# Altium project Interface_Board.PrjPcb
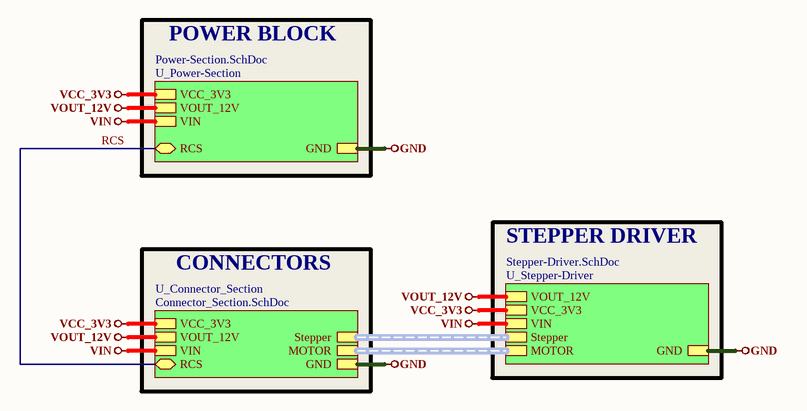
[diagram p0: Top-Sheet.SchDoc]
6 sheets, 66 parts. Net scope: strictly hierarchical (ports join the sheet entries above them; power ports are local).
Board file: InterfaceBoard_PCB.PcbDoc
Sheets:
  Top-Sheet.SchDoc
    U_Power-Section = Power-Section.SchDoc
      U_Pump-Power = Pump-Power.SchDoc
      U_MCU-Power = MCU-Power.SchDoc
    U_Stepper-Driver = Stepper-Driver.SchDoc
    U_Connector_Section = Connector_Section.SchDoc

## Sheet Top-Sheet.SchDoc
size A4; SheetNumber: 1

### Sub-sheets
U_Connector_Section = Connector_Section.SchDoc: GND, VCC_3V3, VOUT_12V, RCS (bidir), Stepper (harness Stepper), VIN, MOTOR (harness MOTOR)
U_Power-Section = Power-Section.SchDoc: VCC_3V3, GND, VOUT_12V, VIN, RCS (bidir)
U_Stepper-Driver = Stepper-Driver.SchDoc: Stepper (harness Stepper), MOTOR (harness MOTOR), VOUT_12V, GND, VCC_3V3, VIN

### Nets
GND: sheet U_Power-Section/GND, sheet U_Stepper-Driver/GND, sheet U_Connector_Section/GND
VCC_3V3: sheet U_Power-Section/VCC_3V3, sheet U_Stepper-Driver/VCC_3V3, sheet U_Connector_Section/VCC_3V3
VIN: sheet U_Power-Section/VIN, sheet U_Stepper-Driver/VIN, sheet U_Connector_Section/VIN
VOUT_12V: sheet U_Power-Section/VOUT_12V, sheet U_Stepper-Driver/VOUT_12V, sheet U_Connector_Section/VOUT_12V
RCS: sheet U_Power-Section/RCS, sheet U_Connector_Section/RCS

### Buses and harness runs
harness sheet U_Connector_Section/MOTOR = sheet U_Stepper-Driver/MOTOR
harness sheet U_Connector_Section/Stepper = sheet U_Stepper-Driver/Stepper

### Notes on the sheet
- POWER BLOCK
- CONNECTORS
- STEPPER DRIVER

## Sheet Power-Section.SchDoc
size A4; SheetNumber: 2
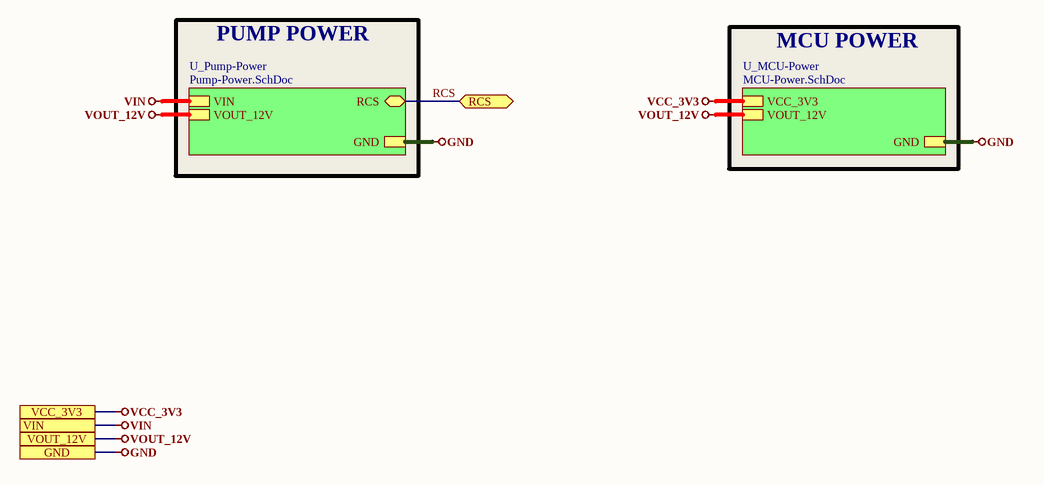
[diagram p1: Power-Section.SchDoc]

### Sub-sheets
U_MCU-Power = MCU-Power.SchDoc: VCC_3V3, GND, VOUT_12V
U_Pump-Power = Pump-Power.SchDoc: RCS (bidir), VOUT_12V, VIN, GND

### Ports
GND, RCS (bidir), VCC_3V3, VIN, VOUT_12V

### Nets
GND: port GND, sheet U_Pump-Power/GND, sheet U_MCU-Power/GND
VCC_3V3: port VCC_3V3, sheet U_MCU-Power/VCC_3V3
VIN: port VIN, sheet U_Pump-Power/VIN
VOUT_12V: port VOUT_12V, sheet U_Pump-Power/VOUT_12V, sheet U_MCU-Power/VOUT_12V
RCS: port RCS, sheet U_Pump-Power/RCS

### Notes on the sheet
- PUMP POWER
- MCU POWER

## Sheet Pump-Power.SchDoc
size A4; SheetNumber: 4
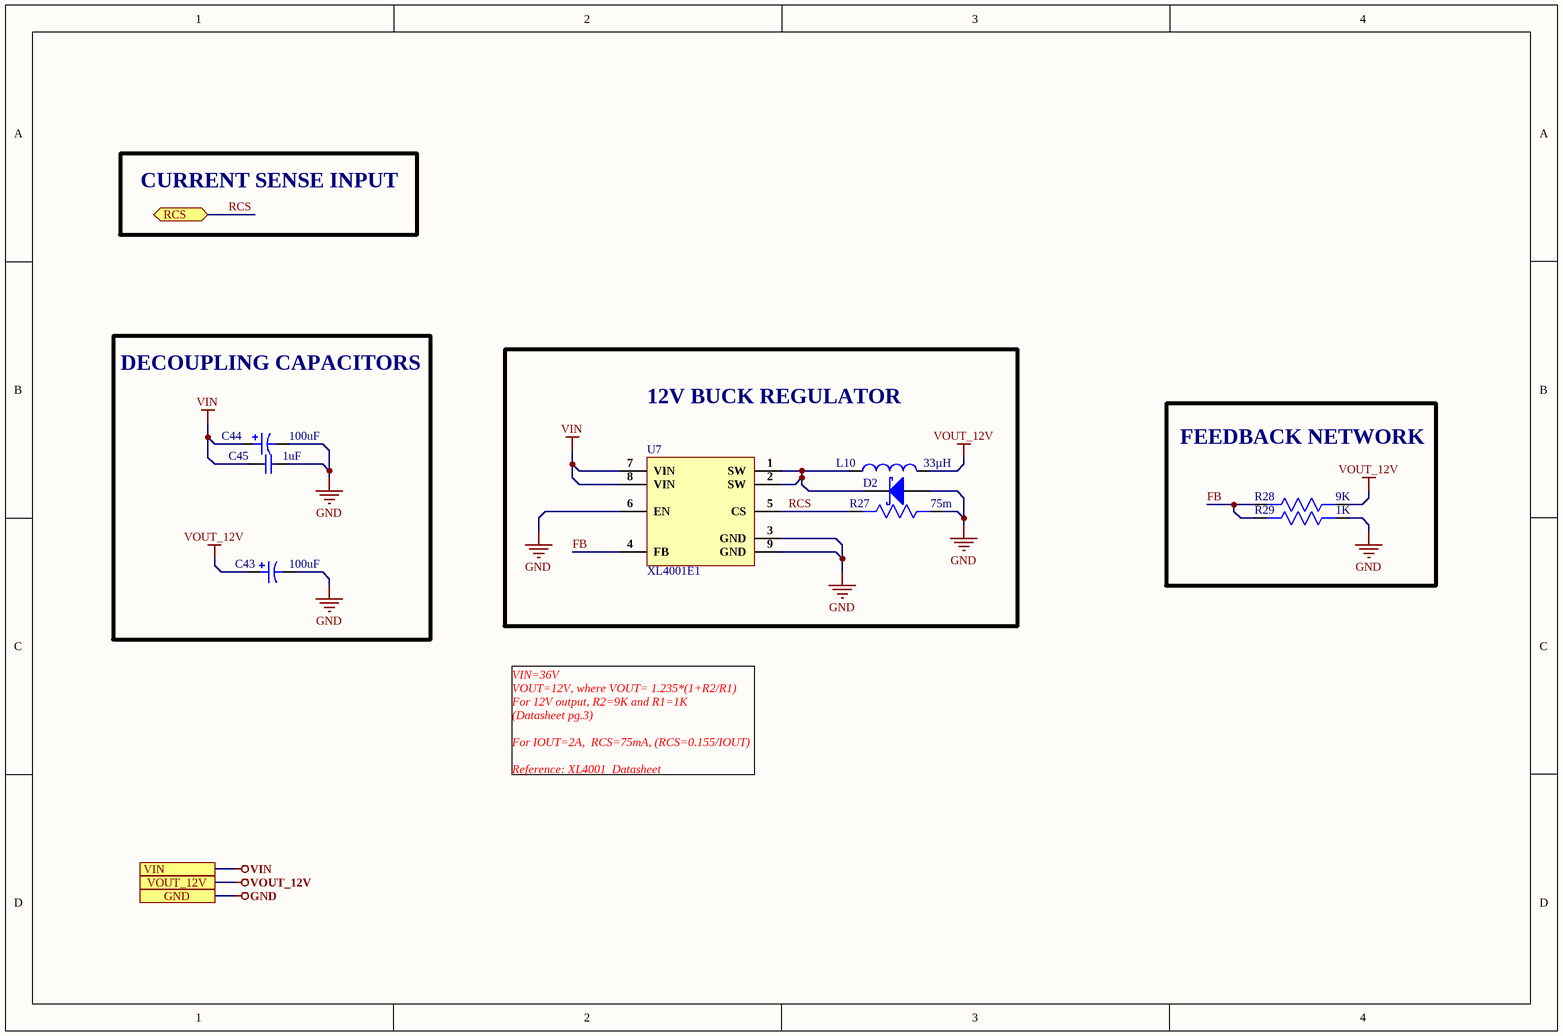
[diagram p2: Pump-Power.SchDoc]

### Parts
C43  100uF  [VKMB1001E101MV]
C44  100uF  [VKMD1001J101MV]
C45  1uF  [Cap0805]
D2  PMEG3030EP,115  [PMEG3030EP,115]  (value not drawn)
L10  33µH  [ETQ-P4M330YFN]
R27  75m  [RES 2512]
R28  9K  [RES 0805]
R29  1K  [Res0603]
U7  XL4001E1  [XL4001E1]

### Blocks framed on the sheet
DECOUPLING CAPACITORS: C43-C45
12V BUCK REGULATOR: D2 L10 R27 U7
FEEDBACK NETWORK: R28 R29

### Ports
GND, RCS (bidir), VIN, VOUT_12V

### Nets
GND: C43.2 C44.2 C45.2 D2.1(A) R27.1 R29.1 U7.3(GND) U7.6(EN) U7.9(GND) ; port GND
VIN: C44.1 C45.1 U7.7(VIN) U7.8(VIN) ; port VIN
VOUT_12V: C43.1 L10.2 R28.1 ; port VOUT_12V
FB: R28.2 R29.2 U7.4(FB)
RCS: R27.2 U7.5(CS) ; port RCS
NetD2_2: D2.2(K) L10.1 U7.1(SW) U7.2(SW)

### Notes on the sheet
- CURRENT SENSE INPUT
- VIN=36V
  VOUT=12V, where VOUT= 1.235*(1+R2/R1)
  For 12V output, R2=9K and R1=1K
  (Datasheet pg.3)
  For IOUT=2A,  RCS=75mA, (RCS=0.155/IOUT)
  Reference: XL4001  Datasheet

### Library data of the parts
C43 = VKMB1001E101MV: 25V 5mm 10mm 100uF 100kHz SMD,5x10mm Aluminum Electrolytic Cap- SMD ROHS; Manufacturer: Ymin; Manufacturer Part No: VKMB1001E101MV; Value: 100uF; Voltage: 25V; ComponentLink1Description: LCSC; ComponentLink1URL: https://lcsc.com/product-detail/Aluminum-Electrolytic-Capacitors-SMD_Ymin-VKMB1001E101MV_C487322.html
C44 = VKMD1001J101MV: 63V 10mm 8mm 100uF ±20% ,8x10mm Aluminum Electrolytic Cap; Manufacturer: Ymin; Manufacturer Part No: VKMD1001J101MV; Value: 100uF; Voltage: 63V; ComponentLink1Description: LCSC; ComponentLink1URL: https://lcsc.com/product-detail/Aluminum-Electrolytic-Capacitors-SMD_Ymin-VKMD1001J101MV_C487384.html
C45 = GCM21BC72A105KE36L: CAP CER 1UF 100V X7S 0805; Manufacturer: Murata; Tolerance: 10%; Supplier 1: Digi-Key; Manufacturer Part Number: GCM21BC72A105KE36L; RoHS: Yes; Category: Ceramic Capacitors; Stock 1: 179138; Pricing 1: 1=0.48000, 10=0.34100, 50=0.25800, 100=0.22480, 500=0.16650, 1000=0.14152 (USD); Mount: Surface Mount; Case/Package: 0805; Case Code (Imperial): 0805; Case Code (Metric): 2012; Min Operating Temperature: -55°C; Max Operating Temperature: 125°C; Packaging: Cut Tape; Capacitance: 1uF; Voltage Rating: 100V; Ratings: AEC-Q200; RoHS Compliant: Yes; ComponentLink1URL: http://search.murata.co.jp/Ceramy/image/img/A01X/partnumbering_e_02.pdf?src-supplier=Digi-Key; ComponentLink1Description: http://search.murata.co.jp/Ceramy/image/img/A01X/partnumbering_e_02.pdf?src-supplier=Digi-Key; Supplier Part Number 1: 490-14436-1-ND
D2 = PMEG3030EP,115: Diode Schottky 30V 3A 2-Pin SOD-128 T/R; Manufacturer: NXP Semiconductors; Manufacturer Part Number: PMEG3030EP-115; Max Reverse Current: 1.5mA; Peak Non-Repetitive Surge Current: 50A; Element Configuration: Single; Forward Voltage: 360mV; Power Dissipation: 625mW; Supplier 1: Newark; RoHS: Yes; Category: Rectifier Diodes; Mount: Surface Mount; Number of Pins: 2; Min Operating Temperature: -55°C; Max Operating Temperature: 150°C; Forward Current: 3A; Max Repetitive Reverse Voltage (Vrrm): 30V; Package Quantity: 1; Max Surge Current: 50A; Packaging: Tape and Reel; Average Rectified Current: 3A; Reverse Voltage: 30V; Max Reverse Voltage (DC): 30V; Series: -; Radiation Hardening: No; Lead Free: Lead Free; ComponentLink1URL: https://datasheet.ciiva.com/4453/pmeg3030ep-103074-4453360.pdf?src-supplier=Mouser; ComponentLink1Description: https://datasheet.ciiva.com/4453/pmeg3030ep-103074-4453360.pdf?src-supplier=Mouser; ComponentLink2URL: https://datasheet.ciiva.com/8299/pmeg3030ep-8299156.pdf?src-supplier=Avnet; ComponentLink2Description: https://datasheet.ciiva.com/8299/pmeg3030ep-8299156.pdf?src-supplier=Avnet; ComponentLink3URL: https://datasheet.ciiva.com/917/pmeg3030ep-917049.pdf?src-supplier=Digi-Key; ComponentLink3Description: https://datasheet.ciiva.com/917/pmeg3030ep-917049.pdf?src-supplier=Digi-Key; ComponentLink4URL: https://datasheet.ciiva.com/917/pmeg3030ep-917048.pdf?src-supplier=Digi-Key; ComponentLink4Description: https://datasheet.ciiva.com/917/pmeg3030ep-917048.pdf?src-supplier=Digi-Key; ComponentLink5URL: https://datasheet.ciiva.com/917/pmeg3030ep-917050.pdf?src-supplier=Digi-Key; ComponentLink5Description: https://datasheet.ciiva.com/917/pmeg3030ep-917050.pdf?src-supplier=Digi-Key; ComponentLink6URL: https://datasheet.ciiva.com/8299/pmeg3030ep-8299301.pdf?src-supplier=Avnet; ComponentLink6Description: https://datasheet.ciiva.com/8299/pmeg3030ep-8299301.pdf?src-supplier=Avnet; Supplier Part Number 1: 85W3397
L10 = ETQ-P4M330YFN: FIXED IND 33UH 2.5A 189.2MOHM SM; Manufacturer: Panasonic; Core Material: Metal,Composite; Tolerance: 20%; Saturation Current: 4.1A; Shielding: Shielded; DC Resistance (DCR): 189.2mR; Test Frequency: 100kHz; Supplier 1: Digi-Key; Manufacturer Part Number: ETQ-P4M330YFN; RoHS: No; Category: Fixed Inductors; Stock 1: 482; Pricing 1: 1=1.56000, 10=1.44400, 25=1.33320, 50=1.11100, 100=1.04430, 250=0.93324 (USD); Mount: Surface Mount; Case/Package: SMD/SMT; Min Operating Temperature: -40°C; Max Operating Temperature: 150°C; Packaging: Tape and Reel; Inductance: 33uH; Current Rating: 2.5A; Ratings: AEC-Q200; ComponentLink1URL: https://industrial.panasonic.com/cdbs/www-data/pdf/AGL0000/AGL0000C59.pdf?src-supplier=Digi-Key; ComponentLink1Description: https://industrial.panasonic.com/cdbs/www-data/pdf/AGL0000/AGL0000C59.pdf?src-supplier=Digi-Key; Supplier Part Number 1: P122549CT-ND
R27 = CSRN2512FK75L0: RES 0.075 OHM 1% 2W 2512; Manufacturer: Stackpole Electronics; Resistance: 75mR; Temperature Coefficient: 200ppm/°C; Supplier 1: Digi-Key; Manufacturer Part Number: CSRN2512FK75L0; RoHS: Yes; Category: Chip SMD Resistors; Stock 1: 153268; Pricing 1: 1=0.58000, 10=0.42500, 25=0.34480, 50=0.30000, 100=0.24750, 250=0.21500, 500=0.17500 (USD); Mount: Surface Mount; Case/Package: 2512; Case Code (Metric): 6432; Case Code (Imperial): 2512; Min Operating Temperature: -55°C; Max Operating Temperature: 155°C; Tolerance: 1%; Packaging: Tape and Reel; Resistor Type: Thick Film; Number of Terminations: 2; Max Power Dissipation: 2W; Series: CSRN; Length: 0.25inch; Width: 0.124inch; Height: 0.028inch; Lead Free: Lead Free; RoHS Compliant: Yes; ComponentLink1URL: https://www.seielect.com/catalog/SEI-Packaging.pdf?src-supplier=Digi-Key; ComponentLink1Description: https://www.seielect.com/catalog/SEI-Packaging.pdf?src-supplier=Digi-Key; ComponentLink2URL: https://www.seielect.com/Catalog/SEI-CSR_CSRN.pdf?src-supplier=Digi-Key; ComponentLink2Description: https://www.seielect.com/Catalog/SEI-CSR_CSRN.pdf?src-supplier=Digi-Key; Supplier Part Number 1: CSRN2512FK75L0CT-ND
R28 = 0805W8F9001T5E: RES SMD 9kΩ ±100ppm/℃ 0.125W 0805; Manufacturer: UNI-ROYAL; Package: 0805; Resistance: 9K; Power(Watts): 0.125W
R29 = RC0603FR-071KL: RES SMD 1K OHM 1% 1/10W 0603; Manufacturer: Yageo; Resistance: 1kR; Temperature Coefficient: 100ppm/°C; Power Rating: 100mW; Voltage Rating: 50V; ComponentLink1URL: https://www.verical.com/server-webapp/html/getDatasheet?partID=409289&src-supplier=Verical; ComponentLink1Description: https://www.verical.com/server-webapp/html/getDatasheet?partID=409289&src-supplier=Verical; Supplier 1: Digi-Key; Manufacturer Part Number: RC0603FR-071KL; Stock 1: 21472395; Pricing 1: 1=0.1, 10=0.023, 100=0.0094, 1000=0.0042, 2500=0.0037 (USD); Case/Package: 0603; Contact Plating: Tin,Matte; Case Code (Imperial): 0603; Case Code (Metric): 1608; Min Operating Temperature: -55°C; Max Operating Temperature: 155°C; Tolerance: 1%; Composition: Thick Film; Packaging: Tape and Reel; Termination: SMD/SMT; Military Standard: Not; Length: 1.6mm; Height: 0.45mm; Depth: 0.8mm; Radiation Hardening: No; REACH SVHC: No SVHC; Lead Free: Lead Free; ComponentLink2URL: http://documents.rs-components.com/techlib://itc_doclist_GB.htm?stockno=5048928&src-supplier=RSComponents; ComponentLink2Description: http://documents.rs-components.com/techlib://itc_doclist_GB.htm?stockno=5048928&src-supplier=RSComponents; ComponentLink3URL: http://www.yageo.com/documents/recent/PYu-RC0603_51_RoHS_L_4.pdf?src-supplier=Avnet+Europe; ComponentLink3Description: http://www.yageo.com/documents/recent/PYu-RC0603_51_RoHS_L_4.pdf?src-supplier=Avnet+Europe; ComponentLink4URL: http://www.farnell.com/datasheets/2167052.pdf?src-supplier=Element14; ComponentLink4Description: http://www.farnell.com/datasheets/2167052.pdf?src-supplier=Element14; ComponentLink5URL: http://www.farnell.com/datasheets/1868787.pdf?src-supplier=Element14; ComponentLink5Description: http://www.farnell.com/datasheets/1868787.pdf?src-supplier=Element14; ComponentLink6URL: http://www.yageo.com/documents/recent/PYu-RC_Group_51_RoHS_L_2.pdf?src-supplier=Avnet; ComponentLink6Description: http://www.yageo.com/documents/recent/PYu-RC_Group_51_RoHS_L_2.pdf?src-supplier=Avnet; ComponentLink7URL: https://www.verical.com/server-webapp/html/getDatasheet?partID=404327&src-supplier=Verical; ComponentLink7Description: https://www.verical.com/server-webapp/html/getDatasheet?partID=404327&src-supplier=Verical; ComponentLink8URL: http://www.farnell.com/datasheets/443971.pdf?src-supplier=Element14; ComponentLink8Description: http://www.farnell.com/datasheets/443971.pdf?src-supplier=Element14; Supplier Part Number 1: 311-1.00KHRDKR-ND
U7 = XL4001E1: 2A 40V SOIC-8_EP_150mil DC-DC Converters ROHS; Manufacturer: XLSEMI; Value: Custom; Manufacturer Part No: XL4001E1; Package: SOIC-8; ComponentLink1Description: LCSC; ComponentLink1URL: https://www.lcsc.com/product-detail/DC-DC-Converters_XLSEMI-XL4001E1_C73347.html

## Sheet MCU-Power.SchDoc
size A4; SheetNumber: 3
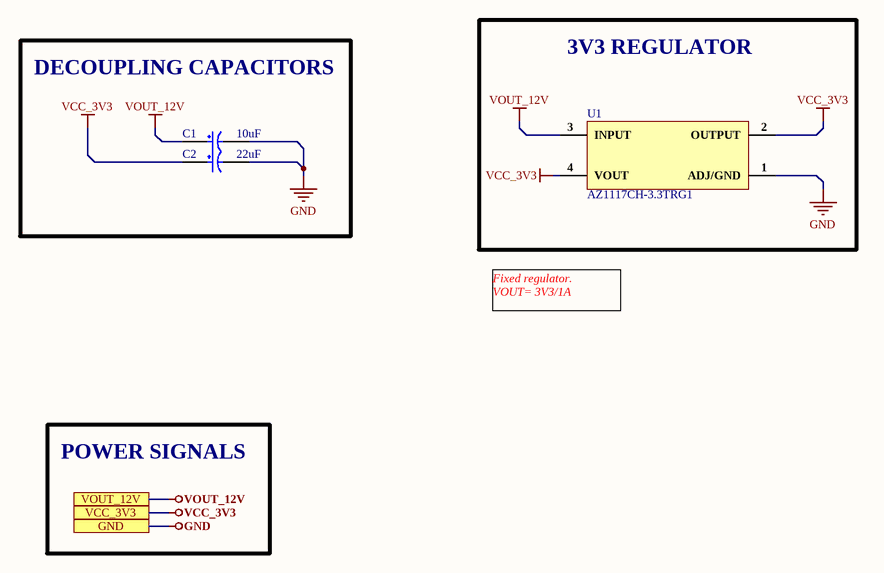
[diagram p3: MCU-Power.SchDoc]

### Parts
C1  10uF  [RVT1E100M0405.]
C2  22uF  [Cap Case-A]
U1  AZ1117CH-3.3TRG1  [AZ1117CH-3.3TRG1]

### Blocks framed on the sheet
DECOUPLING CAPACITORS: C1 C2
3V3 REGULATOR: U1

### Ports
GND, VCC_3V3, VOUT_12V

### Nets
GND: C1.2 C2.1 U1.1(ADJ/GND) ; port GND
VCC_3V3: C2.2 U1.2(OUTPUT) U1.4(VOUT) ; port VCC_3V3
VOUT_12V: C1.1 U1.3(INPUT) ; port VOUT_12V

### Notes on the sheet
- Fixed regulator.
  VOUT= 3V3/1A
- POWER SIGNALS

### Library data of the parts
C1 = RVT1E100M0405: CAP ALUM 10uF 25V SMD; Manufacturer: ROQANG; φD: 4mm; L: 5.4mm; Tolerance: ±20%; Operating Temperature: -45℃~+105℃; Rated Voltage: 25V; Capacitance: 10uF
C2 = CA45A-A-10V-22uF-K: 10V 22uF -55℃~+125℃ 6Ω 100kHz ±10% CASE-A_3216 Tantalum Capacitors ROHS; Manufacturer: CEC(Shenzhen Zhenhua XinYun Elec); Manufacturer Part No: CA45A-A-10V-22uF-K; Package: CASE-A_3216; Value: 22uF; ComponentLink1Description: LCSC; ComponentLink1URL: https://lcsc.com/product-detail/Tantalum-Capacitors_CEC-Shenzhen-Zhenhua-XinYun-Elec-CA45A-A-10V-22uF-K_C141745.html
U1 = AZ1117CH-3.3TRG1: 15V 1.3V @ 800mA Fixed 3.3V SOT-223 Linear Voltage Regulators (LDO) ROHS; Manufacturer: Diodes Incorporated; Value: Custom; Manufacturer Part No: AZ1117CH-3.3TRG1; Package: SOT-223

## Sheet Stepper-Driver.SchDoc
size A4; SheetNumber: 5
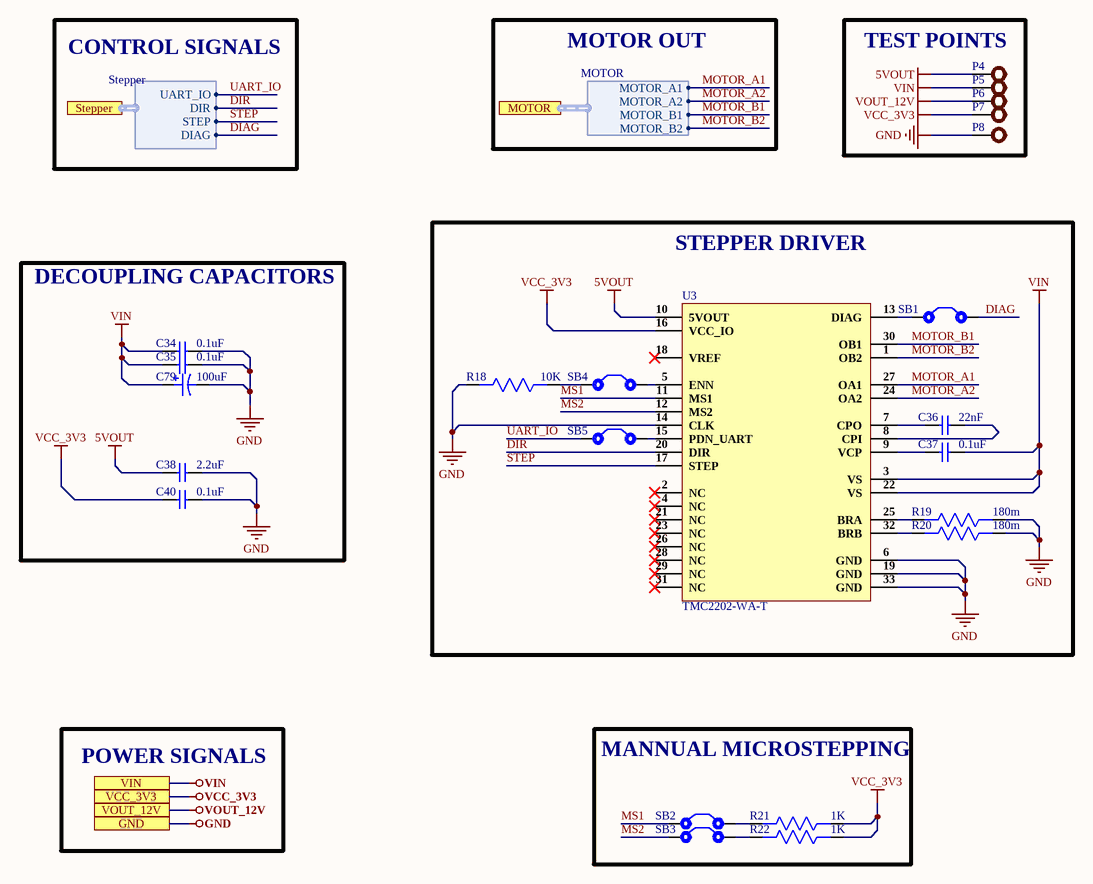
[diagram p4: Stepper-Driver.SchDoc]

### Parts
C34  0.1uF  [Cap0603]
C35  0.1uF  [Cap0603]
C36  22nF  [Cap0603]
C37  0.1uF  [Cap0603]
C38  2.2uF  [Cap0603]
C40  0.1uF  [Cap0603]
C79  100uF  [VKMD1001J101MV]
P4  Test Point  [TEST POINT]  (value not drawn)
P5  Test Point  [TEST POINT]  (value not drawn)
P6  Test Point  [TEST POINT]  (value not drawn)
P7  Test Point  [TEST POINT]  (value not drawn)
P8  Test Point  [TEST POINT]  (value not drawn)
R18  10K  [Res0603]
R19  180m  [RES 2512]
R20  180m  [RES 2512]
R21  1K  [Res0603]
R22  1K  [Res0603]
SB1  Solder Bridge  [Solder Bridge]  (value not drawn)
SB2  Solder Bridge  [Solder Bridge]  (value not drawn)
SB3  Solder Bridge  [Solder Bridge]  (value not drawn)
SB4  Solder Bridge  [Solder Bridge]  (value not drawn)
SB5  Solder Bridge  [Solder Bridge]  (value not drawn)
U3  TMC2202-WA-T  [32-QFN (5x5)]

### Blocks framed on the sheet
TEST POINTS: P4-P8
STEPPER DRIVER: C36 C37 R18-R20 SB1 SB4 SB5 U3
DECOUPLING CAPACITORS: C34 C35 C38 C40 C79
MANNUAL MICROSTEPPING: R21 R22 SB2 SB3

### Ports
GND, MOTOR (harness MOTOR), Stepper (harness Stepper), VCC_3V3, VIN, VOUT_12V

### Harnesses
Stepper: UART_IO, DIR, STEP, DIAG
MOTOR: MOTOR_A1, MOTOR_A2, MOTOR_B1, MOTOR_B2

### Nets
5VOUT: C38.1 P4.1 U3.10(5VOUT)
GND: C34.2 C35.2 C38.2 C40.2 C79.2 P8.1 R18.2 R19.1 R20.1 U3.6(GND) U3.14(CLK) U3.19(GND) U3.33(GND) ; port GND
VCC_3V3: C40.1 P7.1 R21.1 R22.1 U3.16(VCC_IO) ; port VCC_3V3
VIN: C34.1 C35.1 C37.2 C79.1 P5.1 U3.3(VS) U3.22(VS) ; port VIN
VOUT_12V: P6.1 ; port VOUT_12V
DIAG: SB1.2 ; port Stepper.DIAG
DIR: U3.20(DIR) ; port Stepper.DIR
MOTOR_A1: U3.27(OA1) ; port MOTOR.MOTOR_A1
MOTOR_A2: U3.24(OA2) ; port MOTOR.MOTOR_A2
MOTOR_B1: U3.30(OB1) ; port MOTOR.MOTOR_B1
MOTOR_B2: U3.1(OB2) ; port MOTOR.MOTOR_B2
MS1: SB2.1 U3.11(MS1)
MS2: SB3.1 U3.12(MS2)
STEP: U3.17(STEP) ; port Stepper.STEP
UART_IO: SB5.1 ; port Stepper.UART_IO
NetC36_1: C36.1 U3.7(CPO)
NetC36_2: C36.2 U3.8(CPI)
NetC37_1: C37.1 U3.9(VCP)
NetR18_1: R18.1 SB4.1
NetR19_2: R19.2 U3.25(BRA)
NetR20_2: R20.2 U3.32(BRB)
NetR21_2: R21.2 SB2.2
NetR22_2: R22.2 SB3.2
NetSB1_1: SB1.1 U3.13(DIAG)
NetSB4_2: SB4.2 U3.5(ENN)
NetSB5_2: SB5.2 U3.15(PDN_UART)

Not connected (* = marked no-connect by the designer): U3 2(NC)* 4(NC)* 18(VREF)* 21(NC)* 23(NC)* 26(NC)* 28(NC)* 29(NC)* 31(NC)*

### Notes on the sheet
- MOTOR OUT
- CONTROL SIGNALS
- POWER SIGNALS

### Library data of the parts
C34 C35 C37 C40 = CC0603KRX7R0BB104: CAP CER 0.1UF 100V X7R 0603; Manufacturer: Yageo; Capacitance: 100nF; Tolerance: 10%; Supplier 1: Digi-Key; Manufacturer Part Number: CC0603KRX7R0BB104; RoHS: Yes; Category: Ceramic Capacitors; Stock 1: 60476; Pricing 1: 1=0.19000, 10=0.13500, 50=0.07680, 100=0.06370, 500=0.04466, 1000=0.03696 (USD); Mount: Surface Mount; Case/Package: 0603; Case Code (Metric): 1608; Case Code (Imperial): 0603; Weight: 7.1E-05oz; Min Operating Temperature: -55°C; Max Operating Temperature: 125°C; Package Quantity: 4000; Voltage Rating: 100V; Packaging: Tape and Reel; Dielectric: X7R; Termination: SMD/SMT; Resistor Type: Ceramic; Voltage Rating (DC): 100V; Series: CC; Length: 0.063inch; Width: 0.031inch; Thickness: 0.035inch; Depth: 0.8mm; Lead Free: Lead Free; RoHS Compliant: Yes; ComponentLink1URL: https://datasheet.ciiva.com/6277/mlccorderingcode-6277030.pdf?src-supplier=Digi-Key; ComponentLink1Description: https://datasheet.ciiva.com/6277/mlccorderingcode-6277030.pdf?src-supplier=Digi-Key; ComponentLink2URL: https://datasheet.ciiva.com/6277/mlccorderingcode-6277081.pdf?src-supplier=Digi-Key; ComponentLink2Description: https://datasheet.ciiva.com/6277/mlccorderingcode-6277081.pdf?src-supplier=Digi-Key; ComponentLink3URL: https://datasheet.ciiva.com/6277/mlccorderingcode-6277082.pdf?src-supplier=Digi-Key; ComponentLink3Description: https://datasheet.ciiva.com/6277/mlccorderingcode-6277082.pdf?src-supplier=Digi-Key; Supplier Part Number 1: 311-1523-1-ND
C36 = CGA3E2X7R2A223K080AA: CAP CER 0.022UF 100V X7R 0603; Manufacturer: TDK; Tolerance: 10%; Supplier 1: Digi-Key; Manufacturer Part Number: CGA3E2X7R2A223K080AA; RoHS: Yes; Category: Ceramic Capacitors; Stock 1: 56079; Pricing 1: 1=0.11000, 10=0.07600, 50=0.04340, 100=0.03590, 500=0.02516, 1000=0.02083 (USD); Mount: Surface Mount; Case/Package: 0603; Case Code (Metric): 1608; Case Code (Imperial): 0603; Weight: 7.1E-05oz; Min Operating Temperature: -55°C; Max Operating Temperature: 125°C; Capacitance: 22nF; Voltage Rating: 100V; Packaging: Tape and Reel; Voltage Rating (DC): 100V; Dielectric: X7R; Termination: SMD/SMT; Series: CGA; Package Quantity: 1; Resistor Type: Ceramic; Length: 1.6mm; Width: 0.031inch; Height: 0.8mm; Thickness: 0.035inch; Depth: 0.8mm; Ratings: AEC-Q200; RoHS Compliant: Yes; REACH SVHC: No SVHC; ComponentLink1URL: https://datasheet.ciiva.com/22725/1735406-22725648.pdf?src-supplier=Element14; ComponentLink1Description: https://datasheet.ciiva.com/22725/1735406-22725648.pdf?src-supplier=Element14; ComponentLink2URL: https://datasheet.ciiva.com/24218/cga3e2x7r2a223k080aa-266292-24218959.pdf?src-supplier=Mouser; ComponentLink2Description: https://datasheet.ciiva.com/24218/cga3e2x7r2a223k080aa-266292-24218959.pdf?src-supplier=Mouser; ComponentLink3URL: https://datasheet.ciiva.com/7975/1807242-7975349.pdf?src-supplier=Element14; ComponentLink3Description: https://datasheet.ciiva.com/7975/1807242-7975349.pdf?src-supplier=Element14; Supplier Part Number 1: 445-5814-1-ND
C38 = UMK107BBJ225MA-T: CAP CER 2.2UF 50V X5R 0603; Manufacturer: Taiyo Yuden; Supplier 1: Digi-Key; Manufacturer Part Number: UMK107BBJ225MA-T; RoHS: Yes; Category: Ceramic Capacitors; Stock 1: 1; Pricing 1: 1=0.26000, 10=0.18100, 50=0.12060, 100=0.10240, 500=0.07232, 1000=0.06327 (USD); RoHS Compliant: Yes; Supplier Part Number 1: 587-6298-1-ND
C79 = VKMD1001J101MV: as C44 on sheet Pump-Power; Manufacturer Part No: VKMD1001J101MV; Value: 100uF; Voltage: 63V; ComponentLink1Description: LCSC; ComponentLink1URL: https://lcsc.com/product-detail/Aluminum-Electrolytic-Capacitors-SMD_Ymin-VKMD1001J101MV_C487384.html
P4-P8 = TEST POINT: Test Point ON
R18 = AC0603JR-0710KL: RES SMD 10K OHM 5% 1/10W 0603; Manufacturer: Yageo; Voltage Rating: 50V; Resistance: 10kR; Power Rating: 100mW; Temperature Coefficient: 100ppm/°C; Supplier 1: Future Electronics; Manufacturer Part Number: AC0603JR-0710KL; RoHS: Yes; Category: Chip SMD Resistors; Stock 1: 1533000; Pricing 1: 5000=0.00540 (USD); Case/Package: 0603; Case Code (Imperial): 0603; Case Code (Metric): 1608; Size Code: 0603; Min Operating Temperature: -55°C; Max Operating Temperature: 155°C; Packaging: Tape and Reel; Tolerance: 5%; Package Quantity: 1; Resistor Type: Thick Film; Termination: SMD/SMT; Number of Terminations: 2; Max Power Dissipation: 100mW; Features: Moisture Resistant,Automotive AEC-Q200,Anti-Sulfur; Series: AC; Construction: Rectangular; Length: 0.063inch; Width: 0.031inch; Height: 0.022inch; Depth: 0.8mm; Military Standard: Not; Lead Free: Lead Free; RoHS Compliant: Yes; ComponentLink1URL: https://datasheet.ciiva.com/5562/pyu-ac-51-rohs-l-2-5562553.pdf?src-supplier=Mouser; ComponentLink1Description: https://datasheet.ciiva.com/5562/pyu-ac-51-rohs-l-2-5562553.pdf?src-supplier=Mouser; Supplier Part Number 1: 1029044
R19 R20 = RTT25R18JTE: RES SMD ±5% ±200ppm/℃ 0.18Ω 1W 2512; Manufacturer: RALEC; Package: 2512; Tolerance: ±5%; Temperature Coefficient: ±200ppm/℃; Resistance: 0.18Ω; Power(Watts): 1W
R21 R22 = RC0603FR-071KL: as R29 on sheet Pump-Power; ComponentLink1URL: https://www.verical.com/server-webapp/html/getDatasheet?partID=409289&src-supplier=Verical; ComponentLink1Description: https://www.verical.com/server-webapp/html/getDatasheet?partID=409289&src-supplier=Verical; Supplier 1: Digi-Key; Manufacturer Part Number: RC0603FR-071KL; Stock 1: 21472395; Pricing 1: 1=0.1, 10=0.023, 100=0.0094, 1000=0.0042, 2500=0.0037 (USD); Case/Package: 0603; Contact Plating: Tin,Matte; Case Code (Imperial): 0603; Case Code (Metric): 1608; Min Operating Temperature: -55°C; Max Operating Temperature: 155°C; Tolerance: 1%; Composition: Thick Film; Packaging: Tape and Reel; Termination: SMD/SMT; Military Standard: Not; Length: 1.6mm; Height: 0.45mm; Depth: 0.8mm; Radiation Hardening: No; REACH SVHC: No SVHC; Lead Free: Lead Free; ComponentLink2URL: http://documents.rs-components.com/techlib://itc_doclist_GB.htm?stockno=5048928&src-supplier=RSComponents; ComponentLink2Description: http://documents.rs-components.com/techlib://itc_doclist_GB.htm?stockno=5048928&src-supplier=RSComponents; ComponentLink3URL: http://www.yageo.com/documents/recent/PYu-RC0603_51_RoHS_L_4.pdf?src-supplier=Avnet+Europe; ComponentLink3Description: http://www.yageo.com/documents/recent/PYu-RC0603_51_RoHS_L_4.pdf?src-supplier=Avnet+Europe; ComponentLink4URL: http://www.farnell.com/datasheets/2167052.pdf?src-supplier=Element14; ComponentLink4Description: http://www.farnell.com/datasheets/2167052.pdf?src-supplier=Element14; ComponentLink5URL: http://www.farnell.com/datasheets/1868787.pdf?src-supplier=Element14; ComponentLink5Description: http://www.farnell.com/datasheets/1868787.pdf?src-supplier=Element14; ComponentLink6URL: http://www.yageo.com/documents/recent/PYu-RC_Group_51_RoHS_L_2.pdf?src-supplier=Avnet; ComponentLink6Description: http://www.yageo.com/documents/recent/PYu-RC_Group_51_RoHS_L_2.pdf?src-supplier=Avnet; ComponentLink7URL: https://www.verical.com/server-webapp/html/getDatasheet?partID=404327&src-supplier=Verical; ComponentLink7Description: https://www.verical.com/server-webapp/html/getDatasheet?partID=404327&src-supplier=Verical; ComponentLink8URL: http://www.farnell.com/datasheets/443971.pdf?src-supplier=Element14; ComponentLink8Description: http://www.farnell.com/datasheets/443971.pdf?src-supplier=Element14; Supplier Part Number 1: 311-1.00KHRDKR-ND
SB1-SB5 = Solder Bridge: Solder Bridge ON
U3 = TMC2202-WA-T: Stepper Motor Driver/Controller, 5V to 36V, 1 to 256 Microsteps, 1.2A, QFN-32; Manufacturer: Trinamic; Logic Function: AND GATE; Interface: UART; Supplier 1: Digi-Key; Manufacturer Part Number: TMC2202-WA-T; Stock 1: 10; Pricing 1: 1=2.46000, 50=2.21000, 100=1.95000, 500=1.69000, 1000=1.63500 (USD); Mount: Surface Mount; Case/Package: QFN; Min Operating Temperature: -40°C; Max Operating Temperature: 125°C; Packaging: Cut Tape; Output Current: 1.2A; ComponentLink1URL: https://www.trinamic.com/fileadmin/assets/Products/ICs_Documents/TMC220x_TMC222x_datasheet_Rev1.05.pdf?src-supplier=Digi-Key; ComponentLink1Description: https://www.trinamic.com/fileadmin/assets/Products/ICs_Documents/TMC220x_TMC222x_datasheet_Rev1.05.pdf?src-supplier=Digi-Key; Supplier Part Number 1: 1460-1272-1-ND

## Sheet Connector_Section.SchDoc
size A4; SheetNumber: 6
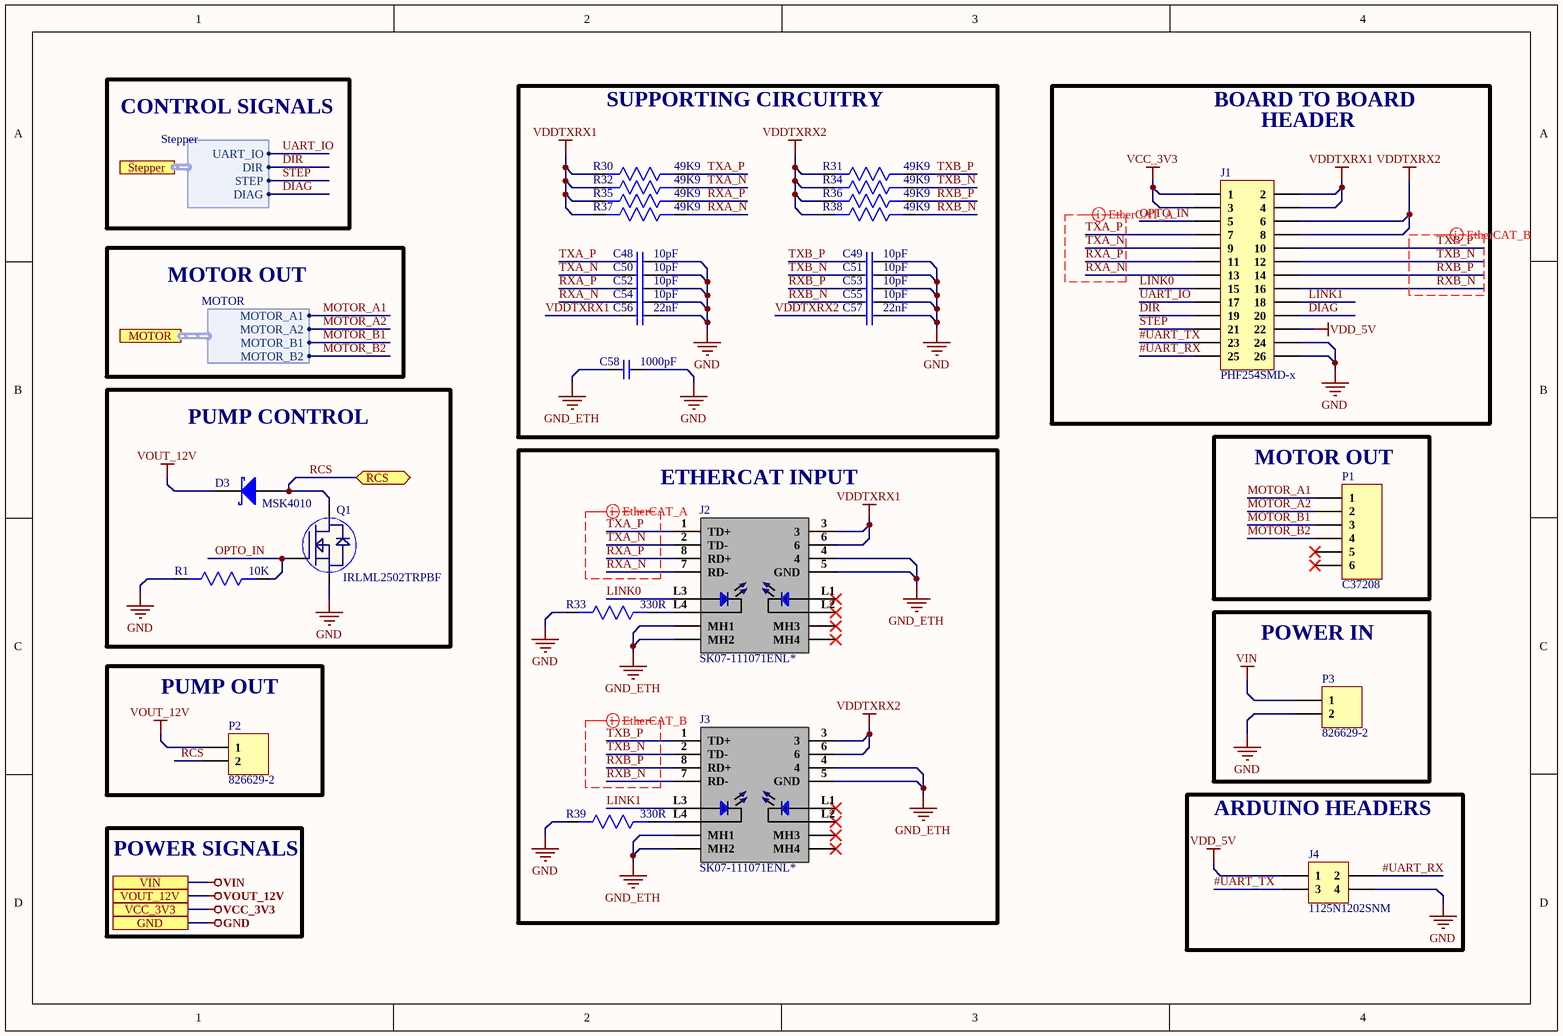
[diagram p5: Connector_Section.SchDoc]

### Parts
C48  10pF  [Cap0603]
C49  10pF  [Cap0603]
C50  10pF  [Cap0603]
C51  10pF  [Cap0603]
C52  10pF  [Cap0603]
C53  10pF  [Cap0603]
C54  10pF  [Cap0603]
C55  10pF  [Cap0603]
C56  22nF  [Cap0603]
C57  22nF  [Cap0603]
C58  1000pF  [Cap1206]
D3  MSK4010  [MSK4010]
J1  PHF254SMD-x  [PHF254SMD-x]
J2  SK07-111071ENL*  [SK07- 111071ENL]
J3  SK07-111071ENL*  [SK07- 111071ENL]
J4  1125N1202SNM  [1125N1202SNM]
P1  C37208  [C37208]
P2  826629-2  [HDR1X2]
P3  826629-2  [HDR1X2]
Q1  IRLML2502TRPBF  [IRLML2502TRPBF]
R1  10K  [Res0603]
R30  49K9  [Res0603]
R31  49K9  [Res0603]
R32  49K9  [Res0603]
R33  330R  [Res0603]
R34  49K9  [Res0603]
R35  49K9  [Res0603]
R36  49K9  [Res0603]
R37  49K9  [Res0603]
R38  49K9  [Res0603]
R39  330R  [Res0603]

### Blocks framed on the sheet
SUPPORTING CIRCUITRY: C48-C58 R30-R32 R34-R38
PUMP CONTROL: D3 Q1 R1
ETHERCAT INPUT: J2 J3 R33 R39
MOTOR OUT: P1
POWER IN: P3
PUMP OUT: P2
ARDUINO HEADERS: J4

### Ports
GND, MOTOR (harness MOTOR), RCS (bidir), Stepper (harness Stepper), VCC_3V3, VIN, VOUT_12V

### Harnesses
Stepper: UART_IO, DIR, STEP, DIAG
MOTOR: MOTOR_A1, MOTOR_A2, MOTOR_B1, MOTOR_B2

### Nets
GND: C48.2 C49.2 C50.2 C51.2 C52.2 C53.2 C54.2 C55.2 C56.2 C57.2 C58.2 J1.24 J1.26 J4.4 P3.2 Q1.2(S) R1.2 R33.2 R39.2 ; port GND
GND_ETH: C58.1 J2.4 J2.5(GND) J2.MH1 J2.MH2 J3.4 J3.5(GND) J3.MH1 J3.MH2
VCC_3V3: J1.1 J1.3 ; port VCC_3V3
VDD_5V: J1.22 J4.1
VDDTXRX1: C56.1 J1.2 J1.4 J2.3 J2.6 R30.2 R32.2 R35.2 R37.2
VDDTXRX2: C57.1 J1.6 J1.8 J3.3 J3.6 R31.2 R34.2 R36.2 R38.2
VIN: P3.1 ; port VIN
VOUT_12V: D3.2(K) P2.1 ; port VOUT_12V
#UART_RX: J1.25 J4.2
#UART_TX: J1.23 J4.3
DIAG: J1.20 ; port Stepper.DIAG
DIR: J1.19 ; port Stepper.DIR
LINK0: J1.15 J2.L3(ANODE)
LINK1: J1.18 J3.L3(ANODE)
MOTOR_A1: P1.1 ; port MOTOR.MOTOR_A1
MOTOR_A2: P1.2 ; port MOTOR.MOTOR_A2
MOTOR_B1: P1.3 ; port MOTOR.MOTOR_B1
MOTOR_B2: P1.4 ; port MOTOR.MOTOR_B2
OPTO_IN: J1.5 Q1.1(G) R1.1
RCS: D3.1(A) P2.2 Q1.3(D) ; port RCS
RXA_N: C54.1 J1.13 J2.7(RD-) R37.1
RXA_P: C52.1 J1.11 J2.8(RD+) R35.1
RXB_N: C55.1 J1.16 J3.7(RD-) R38.1
RXB_P: C53.1 J1.14 J3.8(RD+) R36.1
STEP: J1.21 ; port Stepper.STEP
TXA_N: C50.1 J1.9 J2.2(TD-) R32.1
TXA_P: C48.1 J1.7 J2.1(TD+) R30.1
TXB_N: C51.1 J1.12 J3.2(TD-) R34.1
TXB_P: C49.1 J1.10 J3.1(TD+) R31.1
UART_IO: J1.17 ; port Stepper.UART_IO
NetJ2_L4: J2.L4(CATHODE) R33.1
NetJ3_L4: J3.L4(CATHODE) R39.1

Not connected (* = marked no-connect by the designer): J2 L1(ANODE)* L2(CATHODE)* MH3* MH4*; J3 L1(ANODE)* L2(CATHODE)* MH3* MH4*; P1 5* 6*

### Layout directives
differential pair; differential pair class EtherCAT_B_Lines; net class EtherCAT_B; rule Matched Net Lengths [Tolerance = 1000mil]; rule Impedance Constraint [Min = 90.00    Max = 110.0    ]: RXB_N, RXB_P, TXB_N, TXB_P
differential pair; differential pair class EtherCAT_A_Lines; net class EtherCAT_A; rule Matched Net Lengths [Tolerance = 1000mil]; rule Impedance Constraint [Min = 90.00    Max = 110.0    ]: RXA_N, RXA_P, TXA_N, TXA_P

### Notes on the sheet
- CONTROL SIGNALS
- BOARD TO BOARD
- HEADER
- MOTOR OUT
- POWER SIGNALS

### Library data of the parts
C48-C55 = 06035A100JAT2A: CAP CER 10PF 50V C0G/NP0 0603; Manufacturer: Kyocera AVX; Manufacturer Part Number: 06035A100JAT2A/4K; Tolerance: 5%; Dielectric: C0G; Temperature Coefficient: 30ppm/°C; Insulation Resistance: 100GR; Supplier 1: Digi-Key; Stock 1: 196463; Pricing 1: 1=0.1, 10=0.05, 50=0.0272, 100=0.0222, 500=0.01586, 1000=0.01246 (USD); Mount: Surface Mount; Case/Package: 0603; Number of Pins: 2; Min Operating Temperature: -55°C; Max Operating Temperature: 125°C; Capacitance: 10pF; Packaging: Cut Tape; Voltage Rating (DC): 50V; Voltage: 50V; Length: 1.6mm; Width: 810um; Height: 0.9mm; Depth: 0.81mm; Thickness: 864um; REACH SVHC: No SVHC; Lead Free: Lead Free; Supplier Part Number 1: 478-1163-1-ND
C56 C57 = CGA3E2X7R2A223K080AA: as C36 on sheet Stepper-Driver; Supplier 1: Digi-Key; Manufacturer Part Number: CGA3E2X7R2A223K080AA; RoHS: Yes; Category: Ceramic Capacitors; Stock 1: 56079; Pricing 1: 1=0.11000, 10=0.07600, 50=0.04340, 100=0.03590, 500=0.02516, 1000=0.02083 (USD); Mount: Surface Mount; Case/Package: 0603; Case Code (Metric): 1608; Case Code (Imperial): 0603; Weight: 7.1E-05oz; Min Operating Temperature: -55°C; Max Operating Temperature: 125°C; Capacitance: 22nF; Voltage Rating: 100V; Packaging: Tape and Reel; Voltage Rating (DC): 100V; Dielectric: X7R; Termination: SMD/SMT; Series: CGA; Package Quantity: 1; Resistor Type: Ceramic; Length: 1.6mm; Width: 0.031inch; Height: 0.8mm; Thickness: 0.035inch; Depth: 0.8mm; Ratings: AEC-Q200; RoHS Compliant: Yes; REACH SVHC: No SVHC; ComponentLink1URL: https://datasheet.ciiva.com/22725/1735406-22725648.pdf?src-supplier=Element14; ComponentLink1Description: https://datasheet.ciiva.com/22725/1735406-22725648.pdf?src-supplier=Element14; ComponentLink2URL: https://datasheet.ciiva.com/24218/cga3e2x7r2a223k080aa-266292-24218959.pdf?src-supplier=Mouser; ComponentLink2Description: https://datasheet.ciiva.com/24218/cga3e2x7r2a223k080aa-266292-24218959.pdf?src-supplier=Mouser; ComponentLink3URL: https://datasheet.ciiva.com/7975/1807242-7975349.pdf?src-supplier=Element14; ComponentLink3Description: https://datasheet.ciiva.com/7975/1807242-7975349.pdf?src-supplier=Element14; Supplier Part Number 1: 445-5814-1-ND
C58 = CC1206KKX7RDBB102: 1206 1 nF 2 kV ±10 % Tolerance X7R SMT Multilayer Ceramic Capacitor; Manufacturer: Yageo; Tolerance: 10%; Capacitance: 1nF; Voltage: 2kV; Dissipation Factor: 2.5%; Insulation Resistance: 10GR; Supplier 1: Digi-Key; Manufacturer Part Number: CC1206KKX7RDBB102; RoHS: Yes; Category: Ceramic Capacitors; Stock 1: 19260; Pricing 1: 1=0.35000, 10=0.24000, 50=0.16780, 100=0.14390, 500=0.10794, 1000=0.09114 (USD); Mount: Surface Mount; Case/Package: 1206; Number of Pins: 2; Case Code (Metric): 3216; Case Code (Imperial): 1206; Min Operating Temperature: -55°C; Max Operating Temperature: 125°C; Dielectric: X7R; Package Quantity: 1; Voltage Rating: 2kV; Packaging: Tape and Reel; Voltage Rating (DC): 2kV; Termination: SMD/SMT; Resistor Type: Ceramic; Series: CC; Construction: Flat; Length: 3.2mm; Width: 0.063inch; Height: 1.25mm; Depth: 1.6mm; Thickness: 0.057inch; Radiation Hardening: No; RoHS Compliant: Yes; REACH SVHC: Unknown; Lead Free: Lead Free; ComponentLink1URL: https://datasheet.ciiva.com/23942/1449957-23942422.pdf?src-supplier=Newark; ComponentLink1Description: https://datasheet.ciiva.com/23942/1449957-23942422.pdf?src-supplier=Newark; ComponentLink2URL: https://datasheet.ciiva.com/186/upy-np0x7r-hv-1kv-to-3kv-4-186736.pdf?src-supplier=Digi-Key; ComponentLink2Description: https://datasheet.ciiva.com/186/upy-np0x7r-hv-1kv-to-3kv-4-186736.pdf?src-supplier=Digi-Key; ComponentLink3URL: https://datasheet.ciiva.com/186/upy-np0x7r-hv-1kv-to-3kv-4-186737.pdf?src-supplier=Digi-Key; ComponentLink3Description: https://datasheet.ciiva.com/186/upy-np0x7r-hv-1kv-to-3kv-4-186737.pdf?src-supplier=Digi-Key; ComponentLink4URL: https://datasheet.ciiva.com/13386/upy-gp-np0-16v-to-50v-8-13386312.pdf?src-supplier=Mouser; ComponentLink4Description: https://datasheet.ciiva.com/13386/upy-gp-np0-16v-to-50v-8-13386312.pdf?src-supplier=Mouser; ComponentLink5URL: https://datasheet.ciiva.com/186/upy-np0x7r-hv-1kv-to-3kv-4-186735.pdf?src-supplier=Digi-Key; ComponentLink5Description: https://datasheet.ciiva.com/186/upy-np0x7r-hv-1kv-to-3kv-4-186735.pdf?src-supplier=Digi-Key; Supplier Part Number 1: 311-1487-1-ND
D3 = MSK4010: SOD-523 Schottky Barrier Diodes (SBD) ROHS; Manufacturer: Tak Cheong; Value: Custom; Manufacturer Part No: MSK4010; Pakage: SOD-523; ComponentLink1Description: LCSC; ComponentLink1URL: https://lcsc.com/product-detail/Schottky-Barrier-Diodes-SBD_Tak-Cheong-MSK4010_C968723.html
J1 = PHF254SMD-x: P=2.54mm Female Headers,SMD,ROHS; Manufacturer: RTLECS; Manufacturer Part no:: PHF254SMD-x; Package: Custom; Value: *
J2 J3 = SK07-111071ENL: 10/100 BASE-TX RJ45 WITH LEDS / INTEGRATED MAGNETICS CONNECTOR; Manufacturer: SAK ELECTRONICS CO.,LTD; OPERATION TEMPERATURE RANGE: 0°C TO +70°C; SHIELD: BRASS; THICKNESS: 0.2mm
J4 = 1125N1202SNM: CONN HEADER 4 POS 2.54mm SMD; Manufacturer: RTLECS; Connector type: Pin header Male SMT; Pitch: 2.54; Current rating: 3 A
P1 = C37208: Straight 1 6 2.54mm Black Brass Plugin,P=2.54mm Pin Headers ROHS; Manufacturer: BOOMELEC; Manufacturer Part No:: C37208; Package: Custom; ComponentLink1Description: New link; ComponentLink1URL: https://www.lcsc.com/product-detail/Pin-Headers_BOOMELE-Boom-Precision-Elec-C37208_C37208.html
P2 P3 = 826629-2: CONN HEADER VERT 2POS 2.54MM; Manufacturer: TE Connectivity; Manufacturer Part Number: 8266292; Number of Contacts: 2; Connector Type: Plug,Header,Pin; Current Rating: 3A; Board Standoff: No (Without); High Speed Serial Data Connector: No; PCB Mount Retention: Without; Gender: Male; PCB Mounting Orientation: Vertical; Contact Post Length: 0.1259inch; Plating Thickness: 0.8um; Supplier 1: RSComponents; RoHS: Yes; Category: Board to Board Connectors; Mount: Straddle Mount; Contact Plating: Gold,Tin; Contact Material: Bronze; Color: Green; Housing Color: Green; Housing Material: PBT; Contact Shape: Square; Min Operating Temperature: -65°C; Max Operating Temperature: 105°C; Number of Rows: 1; Termination: Through Hole; Number of Positions: 2; Packaging: Carton; Package Quantity: 3000; Series: AMPMODU MOD II; Contact Type: Male Pin; Contact Gender: Male; Orientation: Straight; Contact Protection: No (Without); Gasket: No (Without); High Temperature Housing: No; Keyed: No; Mating Alignment: No (Without); Mating Connector Lock: No (Without); Selectively Loaded: No (Without); Stabilizers: No (Without); Strain Relief: No (Without); Length: 5.08mm; Pitch: 2.54mm; Contact Mating Length: 6.7mm; Row Spacing: 2.54mm; Depth: 2.5mm; Radiation Hardening: No; Flammability Rating: UL94 V-0; REACH SVHC: No SVHC; ELV: Compliant; Lead Free: Lead Free; ComponentLink1URL: https://datasheet.ciiva.com/11746/0900766b80d7c358-11746248.pdf?src-supplier=RSComponents; ComponentLink1Description: https://datasheet.ciiva.com/11746/0900766b80d7c358-11746248.pdf?src-supplier=RSComponents; ComponentLink2URL: https://datasheet.ciiva.com/30224/8266292-30224019.pdf?src-supplier=Onlinecomponents.com; ComponentLink2Description: https://datasheet.ciiva.com/30224/8266292-30224019.pdf?src-supplier=Onlinecomponents.com; ComponentLink3URL: https://datasheet.ciiva.com/29369/001094754-da-01-en-stiftleiste-1-reihig-0-0826629-2-29369600.pdf?src-supplier=Conrad; ComponentLink3Description: https://datasheet.ciiva.com/29369/001094754-da-01-en-stiftleiste-1-reihig-0-0826629-2-29369600.pdf?src-supplier=Conrad; ComponentLink4URL: https://datasheet.ciiva.com/6857/eng-cd-826629-aa-basefilename-6857135.pdf?src-supplier=Digi-Key; ComponentLink4Description: https://datasheet.ciiva.com/6857/eng-cd-826629-aa-basefilename-6857135.pdf?src-supplier=Digi-Key; ComponentLink5URL: https://datasheet.ciiva.com/14120/eh826629-draw-14120837.pdf?src-supplier=Distrelec; ComponentLink5Description: https://datasheet.ciiva.com/14120/eh826629-draw-14120837.pdf?src-supplier=Distrelec; Supplier Part Number 1: 1361864
Q1 = IRLML2502TRPBF: MOSFET N-CH 20V 4.2A SOT23; Manufacturer: International Rectifier; Rise Time: 10ns; Max Power Dissipation: 1.25W; Gate to Source Voltage (Vgs): 12V; Turn-On Delay Time: 7.5ns; Turn-Off Delay Time: 54ns; Fall Time: 26ns; Threshold Voltage: 1.2V; Rds On Max: 45mR; Input Capacitance: 740pF; Number of Elements: 1; Element Configuration: Single; Supplier 1: Newark; Manufacturer Part Number: IRLML2502TRPBF; RoHS: Yes; Category: MOSFETs; Mount: Surface Mount; Case/Package: SOT-23; Number of Pins: 3; Min Operating Temperature: -55°C; Max Operating Temperature: 150°C; Continuous Drain Current (ID): 4.2A; Drain to Source Voltage (Vdss): 20V; Packaging: Tape and Reel; Package Quantity: 3000; Nominal Vgs: 1.2V; Dual Supply Voltage: 20V; Drain to Source Breakdown Voltage: 20V; Drain to Source Resistance: 45mR; Power Dissipation: 1.25W; Termination: SMD/SMT; Voltage Rating (DC): 20V; Current Rating: 4.2A; On-State Resistance: 45mR; Drain-source On Resistance-Max: 45mR; Length: 2.8mm; Width: 1.4mm; Height: 1.02mm; Radiation Hardening: No; REACH SVHC: No SVHC; Lead Free: Lead Free; ComponentLink1URL: https://datasheet.ciiva.com/36526/1563649-36526014.pdf?src-supplier=Jameco; ComponentLink1Description: https://datasheet.ciiva.com/36526/1563649-36526014.pdf?src-supplier=Jameco; ComponentLink2URL: https://datasheet.ciiva.com/16425/irlml2502pbf-16425943.pdf?src-supplier=Future+Electronics; ComponentLink2Description: https://datasheet.ciiva.com/16425/irlml2502pbf-16425943.pdf?src-supplier=Future+Electronics; ComponentLink3URL: https://datasheet.ciiva.com/6156/irlml2502-6156070.pdf?src-supplier=Farnell; ComponentLink3Description: https://datasheet.ciiva.com/6156/irlml2502-6156070.pdf?src-supplier=Farnell; ComponentLink4URL: https://datasheet.ciiva.com/7935/irlml2502-7935685.pdf?src-supplier=Element14; ComponentLink4Description: https://datasheet.ciiva.com/7935/irlml2502-7935685.pdf?src-supplier=Element14; Supplier Part Number 1: 11X6741
R1 = AC0603JR-0710KL: as R18 on sheet Stepper-Driver; Supplier 1: Future Electronics; Manufacturer Part Number: AC0603JR-0710KL; RoHS: Yes; Category: Chip SMD Resistors; Stock 1: 1533000; Pricing 1: 5000=0.00540 (USD); Case/Package: 0603; Case Code (Imperial): 0603; Case Code (Metric): 1608; Size Code: 0603; Min Operating Temperature: -55°C; Max Operating Temperature: 155°C; Packaging: Tape and Reel; Tolerance: 5%; Package Quantity: 1; Resistor Type: Thick Film; Termination: SMD/SMT; Number of Terminations: 2; Max Power Dissipation: 100mW; Features: Moisture Resistant,Automotive AEC-Q200,Anti-Sulfur; Series: AC; Construction: Rectangular; Length: 0.063inch; Width: 0.031inch; Height: 0.022inch; Depth: 0.8mm; Military Standard: Not; Lead Free: Lead Free; RoHS Compliant: Yes; ComponentLink1URL: https://datasheet.ciiva.com/5562/pyu-ac-51-rohs-l-2-5562553.pdf?src-supplier=Mouser; ComponentLink1Description: https://datasheet.ciiva.com/5562/pyu-ac-51-rohs-l-2-5562553.pdf?src-supplier=Mouser; Supplier Part Number 1: 1029044
R30-R32 R34-R38 = RC0603FR-0749K9L: Res Thick Film 1.6 x 0.8 mm 49.9K Ohm 1% 0.1W(1/10W) 100ppm/ C Molded SMD Paper T/R; Manufacturer: Yageo; Power Rating: 100mW; Resistance: 49.9kR; Temperature Coefficient: 100ppm/°C; Voltage Rating (DC): 50V; Supplier 1: Digi-Key; Manufacturer Part Number: RC0603FR-0749K9L; RoHS: Yes; Category: Chip SMD Resistors; Stock 1: 77863; Pricing 1: 1=0.10000, 10=0.02400, 100=0.00970, 1000=0.00436, 2500=0.00378 (USD); Mount: Surface Mount; Case/Package: 0603; Case Code (Metric): 1608; Case Code (Imperial): 0603; Size Code: 0603; Min Operating Temperature: -55°C; Max Operating Temperature: 155°C; Tolerance: 1%; Packaging: Tape and Reel; Package Quantity: 1; Voltage Rating: 50V; Resistor Type: Thick Film; Number of Terminations: 2; Termination: SMD/SMT; Max Power Dissipation: 100mW; Features: Moisture Resistant; Series: RC; Construction: Rectangular; Length: 0.063inch; Width: 0.031inch; Height: 0.022inch; Depth: 0.8mm; Lead Free: Lead Free; Military Standard: Not; RoHS Compliant: Yes; ComponentLink1URL: https://datasheet.ciiva.com/2454/pyu-r-int-thick-7-2454042.pdf?src-supplier=Digi-Key; ComponentLink1Description: https://datasheet.ciiva.com/2454/pyu-r-int-thick-7-2454042.pdf?src-supplier=Digi-Key; ComponentLink2URL: https://datasheet.ciiva.com/2454/pyu-r-int-thick-7-2454043.pdf?src-supplier=Digi-Key; ComponentLink2Description: https://datasheet.ciiva.com/2454/pyu-r-int-thick-7-2454043.pdf?src-supplier=Digi-Key; ComponentLink3URL: https://datasheet.ciiva.com/2454/pyu-r-int-thick-7-2454044.pdf?src-supplier=Digi-Key; ComponentLink3Description: https://datasheet.ciiva.com/2454/pyu-r-int-thick-7-2454044.pdf?src-supplier=Digi-Key; ComponentLink4URL: https://datasheet.ciiva.com/15189/getdatasheetpartid-323805-15189749.pdf?src-supplier=Verical; ComponentLink4Description: https://datasheet.ciiva.com/15189/getdatasheetpartid-323805-15189749.pdf?src-supplier=Verical; Supplier Part Number 1: 311-49.9KHRCT-ND
R33 R39 = RC0603JR-07330RL: RES  SMD 330R 100 mW 0603; Manufacturer: Yageo; Power Rating: 100mW; Tolerance: 5%; Voltage Rating (DC): 50V; Temperature Coefficient: 100ppm/°C; Supplier 1: Digi-Key; Manufacturer Part Number: RC0603JR-07330RL; RoHS: Yes; Category: Chip SMD Resistors; Stock 1: 1074593; Pricing 1: 1=0.10000, 10=0.02000, 100=0.00800, 1000=0.00360, 2500=0.00312 (USD); Case/Package: 0603; Number of Pins: 2; Case Code (Imperial): 0603; Case Code (Metric): 1608; Size Code: 0603; Min Operating Temperature: -55°C; Max Operating Temperature: 155°C; Resistance: 330R; Packaging: Tape and Reel; Voltage Rating: 50V; Package Quantity: 5000; Termination: SMD/SMT; Resistor Type: Thick Film; Features: Moisture Resistant; Series: RC; Max Power Dissipation: 100mW; Number of Terminations: 2; Resistance Tolerance: 5%; Construction: Rectangular; Length: 1.6mm; Width: 0.8mm; Height: 0.45mm; Depth: 0.8mm; REACH SVHC: No SVHC; Lead Free: Lead Free; Military Standard: Not; RoHS Compliant: Yes; Supplier Part Number 1: 311-330GRCT-ND

## Nets that join several sheets
GND: Pump-Power (9 pins), MCU-Power (C1.2 C2.1 U1.1), Stepper-Driver (13 pins), Connector_Section (19 pins)
VCC_3V3: MCU-Power (C2.2 U1.2 U1.4), Stepper-Driver (5 pins), Connector_Section (J1.1 J1.3)
VIN: Pump-Power (C44.1 C45.1 U7.7 U7.8), Stepper-Driver (7 pins), Connector_Section (P3.1)
VOUT_12V: Pump-Power (C43.1 L10.2 R28.1), MCU-Power (C1.1 U1.3), Stepper-Driver (P6.1), Connector_Section (D3.2 P2.1)
DIAG: Stepper-Driver (SB1.2), Connector_Section (J1.20)
DIR: Stepper-Driver (U3.20), Connector_Section (J1.19)
MOTOR_A1: Stepper-Driver (U3.27), Connector_Section (P1.1)
MOTOR_A2: Stepper-Driver (U3.24), Connector_Section (P1.2)
MOTOR_B1: Stepper-Driver (U3.30), Connector_Section (P1.3)
MOTOR_B2: Stepper-Driver (U3.1), Connector_Section (P1.4)
RCS: Pump-Power (R27.2 U7.5), Connector_Section (D3.1 P2.2 Q1.3)
STEP: Stepper-Driver (U3.17), Connector_Section (J1.21)
UART_IO: Stepper-Driver (SB5.1), Connector_Section (J1.17)